# Altium schematic sheet CPU_PWR - +VCCCORE_2_3.schdoc
size 420 x 298 mm; Symbol: Sheet-Symbol_A3; Company: 嘉立创EDA; Version: V1.0; Page Size: A3; @Project Name: H610(2024/12/09); @Page Count: 36; @Update Date: 2025-10-09; @Create Date: 2025-10-09; @Schematic Name: SCHEMATIC1; @Page No: 28; @Page Name: CPU_PWR - +VCCCORE_2/3; Device: Sheet-Symbol_A3; @Board Name: SCHEMATIC1; @Create Time: 10:15:42; @Update Time: 10:18:20
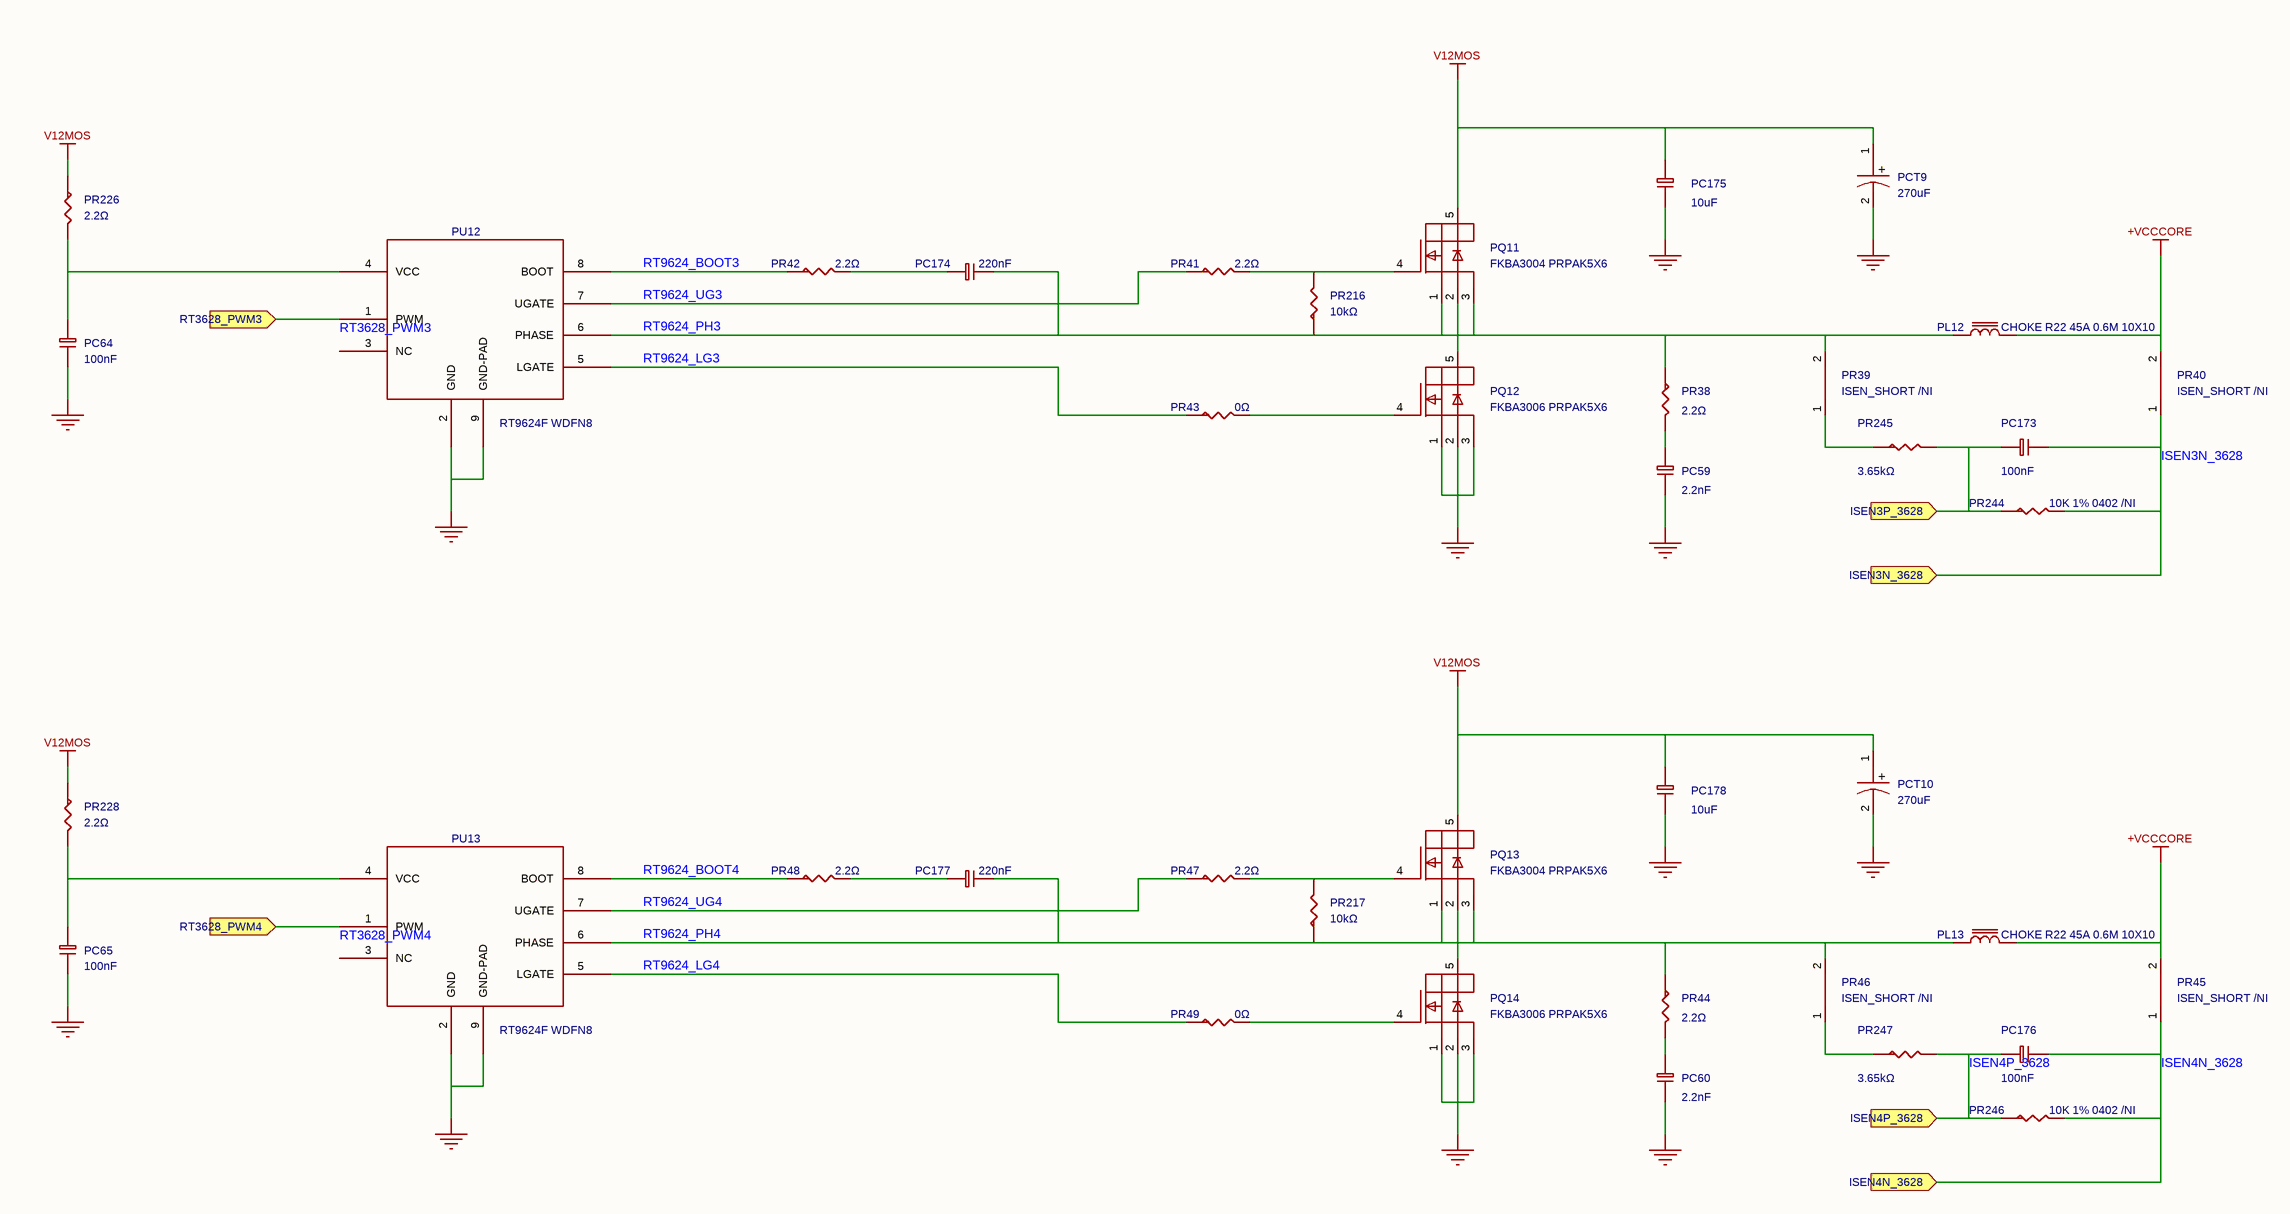
[diagram p0: CPU_PWR - +VCCCORE_2_3.schdoc]

## Parts
PC59  2.2nF  [C0402_2]
PC60  2.2nF  [C0402_3]
PC64  100nF  [C0402_1]
PC65  100nF  [C0402]
PC173  100nF  [C0402]
PC174  220nF  [C0402_1]
PC175  10uF  [C0805]
PC176  100nF  [C0402_1]
PC177  220nF  [C0402_2]
PC178  10uF  [C0805]
PCT9  270uF  [EC1P25C_1]
PCT10  270uF  [EC1P25C_2]
PL12  value CHOKE R22 45A 0.6M 10X10  [MAGIC R22]  (hidden comment: L_L70-P50-H70)
PL13  value CHOKE R22 45A 0.6M 10X10  [MAGIC R22]  (hidden comment: L_L70-P50-H70)
PQ11  value FKBA3004 PRPAK5X6  [PRPAK5X6_1]  (hidden comment: PK616BA)
PQ12  value FKBA3006 PRPAK5X6  [PRPAK5X6]  (hidden comment: PK616BA)
PQ13  value FKBA3004 PRPAK5X6  [PRPAK5X6_2]  (hidden comment: PK616BA)
PQ14  value FKBA3006 PRPAK5X6  [PRPAK5X6_3]  (hidden comment: PK616BA)
PR38  2.2Ω  [R0603_3]
PR39  value ISEN_SHORT /NI  [ISEN_SHORTNI]  (hidden comment: R_0)
PR40  value ISEN_SHORT /NI  [ISEN_SHORTNI]  (hidden comment: R_0)
PR41  2.2Ω  [R0603_1]
PR42  2.2Ω  [R0603_1]
PR43  0Ω  [R0603_3]
PR44  2.2Ω  [R0603_2]
PR45  value ISEN_SHORT /NI  [ISEN_SHORTNI_1]  (hidden comment: R_0)
PR46  value ISEN_SHORT /NI  [ISEN_SHORTNI_1]  (hidden comment: R_0)
PR47  2.2Ω  [R0603_1]
PR48  2.2Ω  [R0603_1]
PR49  0Ω  [R0603_2]
PR216  10kΩ  [R0402_1]
PR217  10kΩ  [R0402_2]
PR226  2.2Ω  [R0603]
PR228  2.2Ω  [R0603_2]
PR244  value 10K 1% 0402 /NI  [R0402_2]  (hidden comment: R-0603)
PR245  3.65kΩ  [R0402_2]
PR246  value 10K 1% 0402 /NI  [R0402_3]  (hidden comment: R-0603)
PR247  3.65kΩ  [R0402_3]
PU12  value RT9624F WDFN8  [DFN8_3X3MM-GND_1]  (hidden comment: RT9624FGQW)
PU13  value RT9624F WDFN8  [DFN8_3X3MM-GND_1]  (hidden comment: RT9624FGQW)

## Ports
ISEN3N_3628 (in), ISEN3P_3628 (in), ISEN4N_3628 (in), ISEN4P_3628 (in), RT3628_PWM3 (in), RT3628_PWM4 (in)

## Nets
+VCCCORE: PL12.2 PL13.2 PR40.2 PR45.2
GND: PC59.2 PC60.2 PC64.2 PC65.2 PC175.1 PC178.1 PCT9.2 PCT10.2 PQ12.1(SOURCE1) PQ12.2(SOURCE2) PQ12.3(SOURCE3) PQ14.1(SOURCE1) PQ14.2(SOURCE2) PQ14.3(SOURCE3) PU12.2(GND) PU12.9(GND-PAD) PU13.2(GND) PU13.9(GND-PAD)
V12MOS: PC175.2 PC178.2 PCT9.1 PCT10.1 PQ11.5(DRAIN1) PQ13.5(DRAIN1) PR226.1 PR228.1
ISEN3N_3628: PC173.2 PR40.1 PR244.2 ; port ISEN3N_3628
ISEN3P_3628: PC173.1 PR244.1 PR245.2 ; port ISEN3P_3628
ISEN4N_3628: PC176.2 PR45.1 PR246.2 ; port ISEN4N_3628
ISEN4P_3628: PC176.1 PR246.1 PR247.2 ; port ISEN4P_3628
RT3628_PWM3: PU12.1(PWM) ; port RT3628_PWM3
RT3628_PWM4: PU13.1(PWM) ; port RT3628_PWM4
RT9624_BOOT3: PR42.1 PU12.8(BOOT)
RT9624_BOOT4: PR48.1 PU13.8(BOOT)
RT9624_LG3: PR43.1 PU12.5(LGATE)
RT9624_LG4: PR49.1 PU13.5(LGATE)
RT9624_PH3: PC174.2 PL12.1 PQ11.1(SOURCE1) PQ11.2(SOURCE2) PQ11.3(SOURCE3) PQ12.5(DRAIN1) PR38.1 PR39.2 PR216.1 PU12.6(PHASE)
RT9624_PH4: PC177.2 PL13.1 PQ13.1(SOURCE1) PQ13.2(SOURCE2) PQ13.3(SOURCE3) PQ14.5(DRAIN1) PR44.1 PR46.2 PR217.1 PU13.6(PHASE)
RT9624_UG3: PR41.1 PU12.7(UGATE)
RT9624_UG4: PR47.1 PU13.7(UGATE)
NetPC59_1: PC59.1 PR38.2
NetPC60_1: PC60.1 PR44.2
NetPC64_1: PC64.1 PR226.2 PU12.4(VCC)
NetPC65_1: PC65.1 PR228.2 PU13.4(VCC)
NetPC174_1: PC174.1 PR42.2
NetPC177_1: PC177.1 PR48.2
NetPQ11_4: PQ11.4(GATE) PR41.2 PR216.2
NetPQ12_4: PQ12.4(GATE) PR43.2
NetPQ13_4: PQ13.4(GATE) PR47.2 PR217.2
NetPQ14_4: PQ14.4(GATE) PR49.2
NetPR39_1: PR39.1 PR245.1
NetPR46_1: PR46.1 PR247.1

Not connected (* = marked no-connect by the designer): PU12 3(NC); PU13 3(NC)

## Notes on the sheet
- 更新日期
- 2025-10-09
- 原理图
- 图页
- SCHEMATIC1
- CPU_PWR - +VCCCORE_2/3
- 创建日期
- 物料编码
- 审阅
- 绘制
- H610(2024/12/09)
- 版本
- V1.0
- 尺寸
- A3
- 页
- 28
- 嘉立创EDA
- 共
- 36
- (in symbol 160AREC271M0609) +

## Library data of the parts
PC59 PC60 = CC0402KRX7R9BB222: 容值:2.2nF;精度:±10%;额定电压:50V;材质(温度系数):X7R;; Manufacturer: YAGEO(国巨); Symbol: CAP; PCB Footprint: C0402; Tolerance: ±10%; ModelId: 36a51122f27c49738f86b3bfa98863e0; AddInBom: yes; Voltage Rated: 50V; ModelName: C0402_L1.0-W0.5-H0.5; ModelTransform: 39.37,19.685,0,0,0,0,0,0,0; Temperature Coefficient: X7R; Device: CC0402KRX7R9BB222; Value: 2.2nF; Supplier: LCSC; Datasheet: https://atta.szlcsc.com/upload/public/pdf/source/20170505/1493957848374.pdf; SupplierPart: C106861; ConvertToPcb: yes; LCSC Part Name: 2.2nF ±10% 50V; JLCPCB Part Class: Extended Part; ManufacturerPart: CC0402KRX7R9BB222; Supplier Footprint: 0402
  PC59: FootprintName: C0402_2
  PC60: FootprintName: C0402_3
PC64 PC176 = CL05B104KO5NNNC: 容值:100nF;精度:±10%;额定电压:16V;材质(温度系数):X7R;; Manufacturer: SAMSUNG(三星); Symbol: CAP; PCB Footprint: C0402; Tolerance: ±10%; ModelId: 36a51122f27c49738f86b3bfa98863e0; AddInBom: yes; Voltage Rated: 16V; ModelName: C0402_L1.0-W0.5-H0.5; ModelTransform: 39.37,19.685,0,0,0,0,0,0,0; Temperature Coefficient: X7R; Device: CL05B104KO5NNNC; Value: 100nF; Supplier: LCSC; Datasheet: https://atta.szlcsc.com/upload/public/pdf/source/20160103/1457707674891.pdf; FootprintName: C0402_1; SupplierPart: C1525; ConvertToPcb: yes; LCSC Part Name: 100nF ±10% 16V; JLCPCB Part Class: Basic Part; ManufacturerPart: CL05B104KO5NNNC; Supplier Footprint: 0402
PC65 PC173 = CL05B104KO5NNNC: 容值:100nF;精度:±10%;额定电压:16V;材质(温度系数):X7R;; Manufacturer: SAMSUNG(三星); Symbol: CAP; Tolerance: ±10%; ModelId: 36a51122f27c49738f86b3bfa98863e0; AddInBom: yes; Voltage Rated: 16V; ModelName: C0402_L1.0-W0.5-H0.5; ModelTransform: 39.37,19.685,0,0,0,0,0,0,0; Temperature Coefficient: X7R; Device: CL05B104KO5NNNC; PCB Footprint: C0402; Value: 100nF; Supplier: LCSC; Datasheet: https://atta.szlcsc.com/upload/public/pdf/source/20160103/1457707674891.pdf; FootprintName: C0402; SupplierPart: C1525; ConvertToPcb: yes; LCSC Part Name: 100nF ±10% 16V; JLCPCB Part Class: Basic Part; ManufacturerPart: CL05B104KO5NNNC; Supplier Footprint: 0402
PC174 PC177 = CC0402KRX5R7BB224: 容值:220nF;精度:±10%;额定电压:16V;材质(温度系数):X5R;; Manufacturer: YAGEO(国巨); Symbol: CAP; PCB Footprint: C0402; Tolerance: ±10%; ModelId: 36a51122f27c49738f86b3bfa98863e0; AddInBom: yes; Voltage Rated: 16V; ModelName: C0402_L1.0-W0.5-H0.5; ModelTransform: 39.37,19.685,0,0,0,0,0,0,0; Temperature Coefficient: X5R; Device: CC0402KRX5R7BB224; Value: 220nF; Supplier: LCSC; Datasheet: https://atta.szlcsc.com/upload/public/pdf/source/20170728/C106258_1501225689337848724.pdf; SupplierPart: C106258; ConvertToPcb: yes; LCSC Part Name: 220nF ±10% 16V; JLCPCB Part Class: Extended Part; ManufacturerPart: CC0402KRX5R7BB224; Supplier Footprint: 0402
  PC174: FootprintName: C0402_1
  PC177: FootprintName: C0402_2
PC175 PC178 = CL21A106KOQNNNE: 容值:10uF;精度:±10%;额定电压:16V;材质(温度系数):X5R;; Manufacturer: SAMSUNG(三星); Symbol: CAP NP_31; ModelId: 1ba041120af144c991958decab20d241; Tolerance: ±10%; AddInBom: yes; Voltage Rated: 16V; ModelName: C0805_L2.0-W1.3-H1.3; ModelTransform: 78.74,51.181,0,0,0,0,0,0.0005,0; Temperature Coefficient: X5R; Device: CL21A106KOQNNNE; Value: 10uF; Supplier: LCSC; Datasheet: https://atta.szlcsc.com/upload/public/pdf/source/20160103/1457707694240.pdf; FootprintName: C0805; SupplierPart: C1713; ConvertToPcb: yes; LCSC Part Name: 10uF ±10% 16V; JLCPCB Part Class: Extended Part; ManufacturerPart: CL21A106KOQNNNE; Supplier Footprint: 0805
PCT9 PCT10 = 160AREC271M0609: 容值:270uF;精度:±20%;额定电压:16V;纹波电流:3.8A@100kHz;等效串联电阻:15mΩ@100kHz~300kHz;类型:-;; Manufacturer: APAQ(钰邦); Symbol: CAPACITOR POL_0; AddInBom: yes; ModelId: 0a4db4bf24b443b3be4905be97ff10c5; ModelName: CAP-TH_BD6.3-P2.50-D1.0-FD; ModelTransform: 248.4247,247.99777,0,0,0,0,0,0,-137.795; Tolerance: ±20%; Rated Voltage: 16V; φD: 6.3mm; L: 9mm; Lifetime @ Temp: 2000hrs@105℃; Device: 160AREC271M0609; Value: 270uF; LCSC Part Name: 270uF ±20% 16V; SupplierPart: C176312; ManufacturerPart: 160AREC271M0609; Supplier Footprint: 插件,D6.3xL9mm; JLCPCB Part Class: Extended Part; Datasheet: https://atta.szlcsc.com/upload/public/pdf/source/20180420/C176312_A6CC051F3F5535015096354530D22B11.pdf; Supplier: LCSC; ConvertToPcb: yes; Ripple Current: 3.8A@100kHz; Equivalent Series Resistance(ESR): 15mΩ@100kHz~300kHz; Type: -; Lead Spacing: 2.5mm; Operating Temperature: -55℃~+105℃
  PCT9: FootprintName: EC1P25C_1
  PCT10: FootprintName: EC1P25C_2
PL12 = L_L70-P50-H70_1: Check: false; AddInBom: yes; Device: L_L70-P50-H70_1; Symbol: L_L70-P50-H70; FootprintName: MAGIC R22; ConvertToPcb: yes
PL13 = L_L70-P50-H70_2: Check: false; AddInBom: yes; Device: L_L70-P50-H70_2; Symbol: L_L70-P50-H70; FootprintName: MAGIC R22; ConvertToPcb: yes
PQ11-PQ14 = PK616BA: 类型:1个N沟道;漏源电压(Vdss):30V;连续漏极电流(Id):50A;功率(Pd):31W;导通电阻(RDS(on)@Vgs,Id):9.5mΩ@4.5V,13A;阈值电压(Vgs(th)@Id):3V@250uA;; Manufacturer: NIKO-SEM(尼克森); Symbol: MOS-N_SO8_1; AddInBom: yes; ModelId: 178189b27e7544aca50c111426555358; ModelName: PDFN-8_L4.9-W5.8-H1.0-P1.27; ModelTransform: 200.787,240.157,0,0,0,0,-0.097,0,0; Drain Source Voltage (Vdss): 30V; Continuous Drain Current (Id): 50A; Power Dissipation (Pd): 31W; Device: PK616BA; LCSC Part Name: 1个N沟道 耐压:30V 电流:50A; SupplierPart: C133608; ManufacturerPart: PK616BA; Supplier Footprint: PDFN-8(5.8x4.9); JLCPCB Part Class: Extended Part; Datasheet: https://atta.szlcsc.com/upload/public/pdf/source/20170930/C133608_1506736454344997453.pdf; Supplier: LCSC; ConvertToPcb: yes; Type: 1个N沟道; Drain Source On Resistance (RDS(on)@Vgs,Id): 9.5mΩ@4.5V,13A; Gate Threshold Voltage (Vgs(th)@Id): 3V@250uA
  PQ11: FootprintName: PRPAK5X6_1
  PQ12: FootprintName: PRPAK5X6
  PQ13: FootprintName: PRPAK5X6_2
  PQ14: FootprintName: PRPAK5X6_3
PR38 PR41 PR42 PR44 PR47 PR48 PR228 = 0603WAF220KT5E: 电阻类型:厚膜电阻;阻值:2.2Ω;精度:±1%;功率:100mW;; Manufacturer: UNI-ROYAL(厚声); Symbol: R_1; ModelId: fc143cca1e79419f9cd78b61e9279f08; Tolerance: ±1%; AddInBom: yes; Power(Watts): 100mW; ModelName: R0603; ModelTransform: 31.8897,63.7794,0,90,0,0,0,0,0; Overload Voltage (Max): 75V; Temperature Coefficient: ±400ppm/℃; Device: 0603WAF220KT5E; Value: 2.2Ω; Type: 厚膜电阻; Supplier: LCSC; Datasheet: https://atta.szlcsc.com/upload/public/pdf/source/20200306/C422600_1E6D84923E4A46A82E41ADD87F860B5C.pdf; SupplierPart: C22939; ConvertToPcb: yes; LCSC Part Name: 2.2Ω ±1% 100mW; JLCPCB Part Class: Basic Part; ManufacturerPart: 0603WAF220KT5E; Supplier Footprint: 0603; Operating Temperature Range: -55℃~+155℃
  PR38: FootprintName: R0603_3
  PR41 PR42 PR47 PR48: FootprintName: R0603_1
  PR44 PR228: FootprintName: R0603_2
PR39 = R_0: Check: false; AddInBom: yes; Device: R_0; Symbol: R_0; FootprintName: ISEN_SHORTNI; ConvertToPcb: yes
PR40 = R_0: 跳线; Check: false; AddInBom: yes; Device: R_0; Symbol: R_0; FootprintName: ISEN_SHORTNI; ConvertToPcb: yes
PR43 PR49 = 0603WAF0000T5E: 电阻类型:厚膜电阻;阻值:0Ω;精度:±1%;功率:100mW;; Manufacturer: UNI-ROYAL(厚声); Symbol: R_1; ModelId: fc143cca1e79419f9cd78b61e9279f08; Tolerance: ±1%; AddInBom: yes; Power(Watts): 100mW; ModelName: R0603; ModelTransform: 31.8897,63.7794,0,90,0,0,0,0,0; Overload Voltage (Max): 75V; Device: 0603WAF0000T5E; Value: 0Ω; Type: 厚膜电阻; Supplier: LCSC; Datasheet: https://atta.szlcsc.com/upload/public/pdf/source/20200306/C422600_1E6D84923E4A46A82E41ADD87F860B5C.pdf; SupplierPart: C21189; ConvertToPcb: yes; LCSC Part Name: 0Ω ±1% 100mW; JLCPCB Part Class: Basic Part; ManufacturerPart: 0603WAF0000T5E; Supplier Footprint: 0603; Operating Temperature Range: -55℃~+155℃
  PR43: FootprintName: R0603_3
  PR49: FootprintName: R0603_2
PR45 PR46 = R_1: Check: false; AddInBom: yes; Device: R_1; Symbol: R_0; FootprintName: ISEN_SHORTNI_1; ConvertToPcb: yes
PR216 PR217 = 0402WGF1002TCE: 电阻类型:厚膜电阻;阻值:10kΩ;精度:±1%;功率:62.5mW;; Manufacturer: UNI-ROYAL(厚声); Symbol: R-0603; ModelId: 671aefced39d4c318694bba8bd8efd39; Tolerance: ±1%; AddInBom: yes; Power(Watts): 62.5mW; ModelName: R0402_L1.0-W0.5-H0.5; ModelTransform: 39.37,19.685,0,0,0,0,0,0.0005,0; Overload Voltage (Max): 50V; Temperature Coefficient: ±100ppm/℃; Device: 0402WGF1002TCE; Value: 10kΩ; Type: 厚膜电阻; Supplier: LCSC; Datasheet: https://atta.szlcsc.com/upload/public/pdf/source/20200306/C422600_1E6D84923E4A46A82E41ADD87F860B5C.pdf; SupplierPart: C25744; ConvertToPcb: yes; LCSC Part Name: 10kΩ ±1% 62.5mW; JLCPCB Part Class: Basic Part; ManufacturerPart: 0402WGF1002TCE; Supplier Footprint: 0402; Operating Temperature Range: -55℃~+155℃
  PR216: FootprintName: R0402_1
  PR217: FootprintName: R0402_2
PR226 = 0603WAF220KT5E: 电阻类型:厚膜电阻;阻值:2.2Ω;精度:±1%;功率:100mW;; Manufacturer: UNI-ROYAL(厚声); Symbol: R_1; ModelId: fc143cca1e79419f9cd78b61e9279f08; Tolerance: ±1%; AddInBom: yes; Power(Watts): 100mW; ModelTransform: 31.8897,63.7794,0,90,0,0,0,0,0; Overload Voltage (Max): 75V; Temperature Coefficient: ±400ppm/℃; Device: 0603WAF220KT5E; Value: 2.2Ω; Type: 厚膜电阻; Supplier: LCSC; Datasheet: https://atta.szlcsc.com/upload/public/pdf/source/20200306/C422600_1E6D84923E4A46A82E41ADD87F860B5C.pdf; FootprintName: R0603; SupplierPart: C22939; ModelName: R0603; ConvertToPcb: yes; LCSC Part Name: 2.2Ω ±1% 100mW; JLCPCB Part Class: Basic Part; ManufacturerPart: 0603WAF220KT5E; Supplier Footprint: 0603; Operating Temperature Range: -55℃~+155℃
PR244 = R-0603_2: Manufacturer: YAGEO(国巨); Manufacturer Part: RC0402FR-0710KL; 3D Model: 671aefced39d4c318694bba8bd8efd39; 3D Model Transform: 39.37,19.685,0,0,0,0,0,0.0005,0; Tolerance: ±1%; Power(Watts): 62.5mW; Overload Voltage (Max): 50V; Temperature Coefficient: ±100ppm/℃; AddInBom: yes; Device: R-0603_2; Symbol: R-0603; LCSC Part Name: 厚膜电阻 10kΩ ±1% 62.5mW; Supplier Part: C60490; Supplier Footprint: 0402; JLCPCB Part Class: Extended Part; Datasheet: https://atta.szlcsc.com/upload/public/pdf/source/20170925/C131467_1506321478108990263.pdf; Supplier: LCSC; Type: 厚膜电阻; Operating Temperature Range: -55℃~+155℃; FootprintName: R0402_2; ConvertToPcb: yes
PR245 PR247 = ERJ2RKF3651X: 电阻类型:厚膜电阻;阻值:3.65kΩ;精度:±1%;功率:100mW;最大工作电压:100V;温度系数:±100ppm/℃;; Manufacturer: PANASONIC(松下); Symbol: R-0603; AddInBom: yes; ModelId: 671aefced39d4c318694bba8bd8efd39; ModelName: R0402_L1.0-W0.5-H0.5; ModelTransform: 39.37,19.685,0,0,0,0,0,0.0005,0; Tolerance: ±1%; Power(Watts): 100mW; Overload Voltage (Max): 100V; Device: ERJ2RKF3651X; Value: 3.65kΩ; LCSC Part Name: 3.65kΩ ±1% 100mW 厚膜电阻; SupplierPart: C416527; ManufacturerPart: ERJ2RKF3651X; Supplier Footprint: 0402; JLCPCB Part Class: Extended Part; Datasheet: https://atta.szlcsc.com/upload/public/pdf/source/20190902/C416527_C4564A8D72F3E2A9CDC3D7769B95121D.pdf; Supplier: LCSC; ConvertToPcb: yes; Type: 厚膜电阻; Temperature Coefficient: ±100ppm/℃; Operating Temperature Range: -55℃~+155℃
  PR245: FootprintName: R0402_2
  PR247: FootprintName: R0402_3
PR246 = R-0603: Manufacturer: YAGEO(国巨); Manufacturer Part: RC0402FR-0710KL; 3D Model: 671aefced39d4c318694bba8bd8efd39; 3D Model Transform: 39.37,19.685,0,0,0,0,0,0.0005,0; Tolerance: ±1%; Power(Watts): 62.5mW; Overload Voltage (Max): 50V; Temperature Coefficient: ±100ppm/℃; AddInBom: yes; Device: R-0603; Symbol: R-0603; LCSC Part Name: 厚膜电阻 10kΩ ±1% 62.5mW; Supplier Part: C60490; Supplier Footprint: 0402; JLCPCB Part Class: Extended Part; Datasheet: https://atta.szlcsc.com/upload/public/pdf/source/20170925/C131467_1506321478108990263.pdf; Supplier: LCSC; Type: 厚膜电阻; Operating Temperature Range: -55℃~+155℃; FootprintName: R0402_3; ConvertToPcb: yes
PU12 PU13 = RT9624FGQW: Manufacturer: RICHTEK(立锜); Symbol: RT9624F_1; AddInBom: yes; ModelId: 87cbd0851a6d45bba9a717edfc43b2c9; ModelName: TDFN-8_L3.0-W3.0-P0.65-BL-EP2.3; ModelTransform: 118.11,118.8974,0,0,0,0,0,0,0; Device: RT9624FGQW; LCSC Part Name: Single Phase Synchronous Rectified Buck MOSFET Driver; SupplierPart: C3020454; ManufacturerPart: RT9624FGQW; Supplier Footprint: TDFN-8-EP(3x3); JLCPCB Part Class: Extended Part; Datasheet: https://atta.szlcsc.com/upload/public/pdf/source/20220608/64F557171D909C63F38446B0F2BC2FB2.pdf; Supplier: LCSC; ConvertToPcb: yes; FootprintName: DFN8_3X3MM-GND_1